# EasyEDA Pro project lovelessing-d133-mobile-phone-development-bo-91bf7213.epro, schematic Schematic1_1, sheets 4 to 5 of 5

## Sheets
4 AUDIO
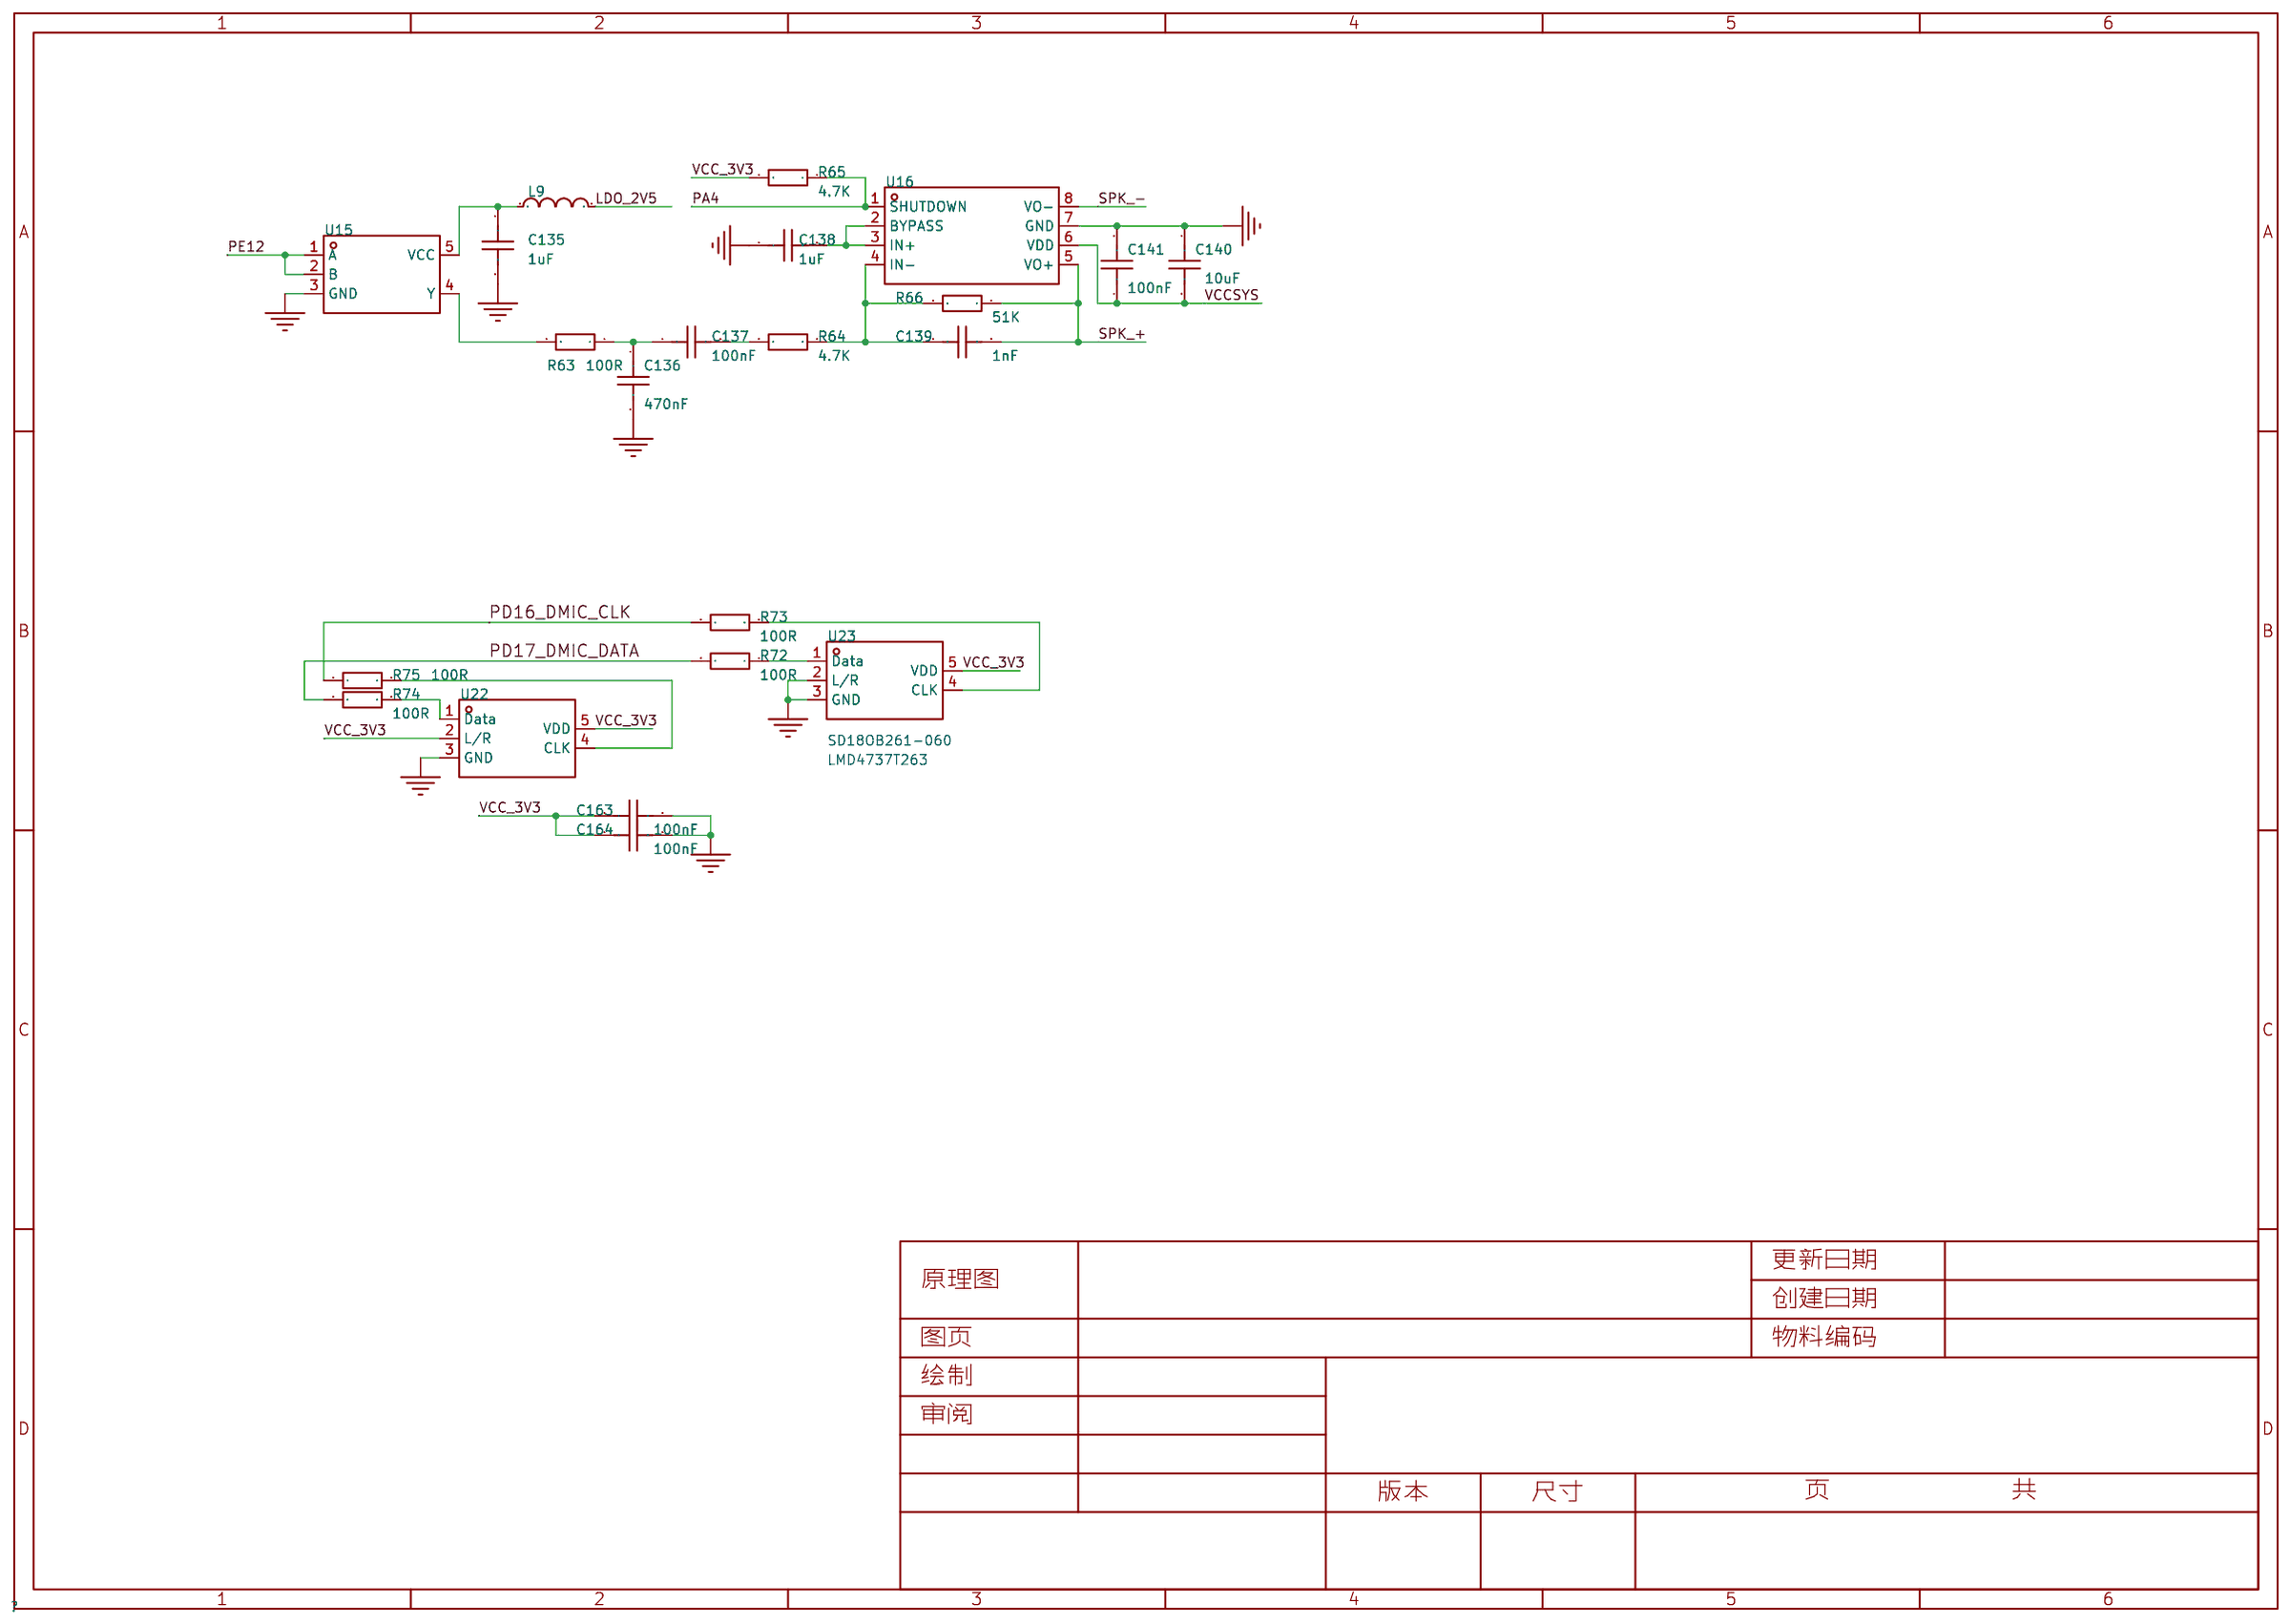
[diagram p4: AUDIO]
5 USB
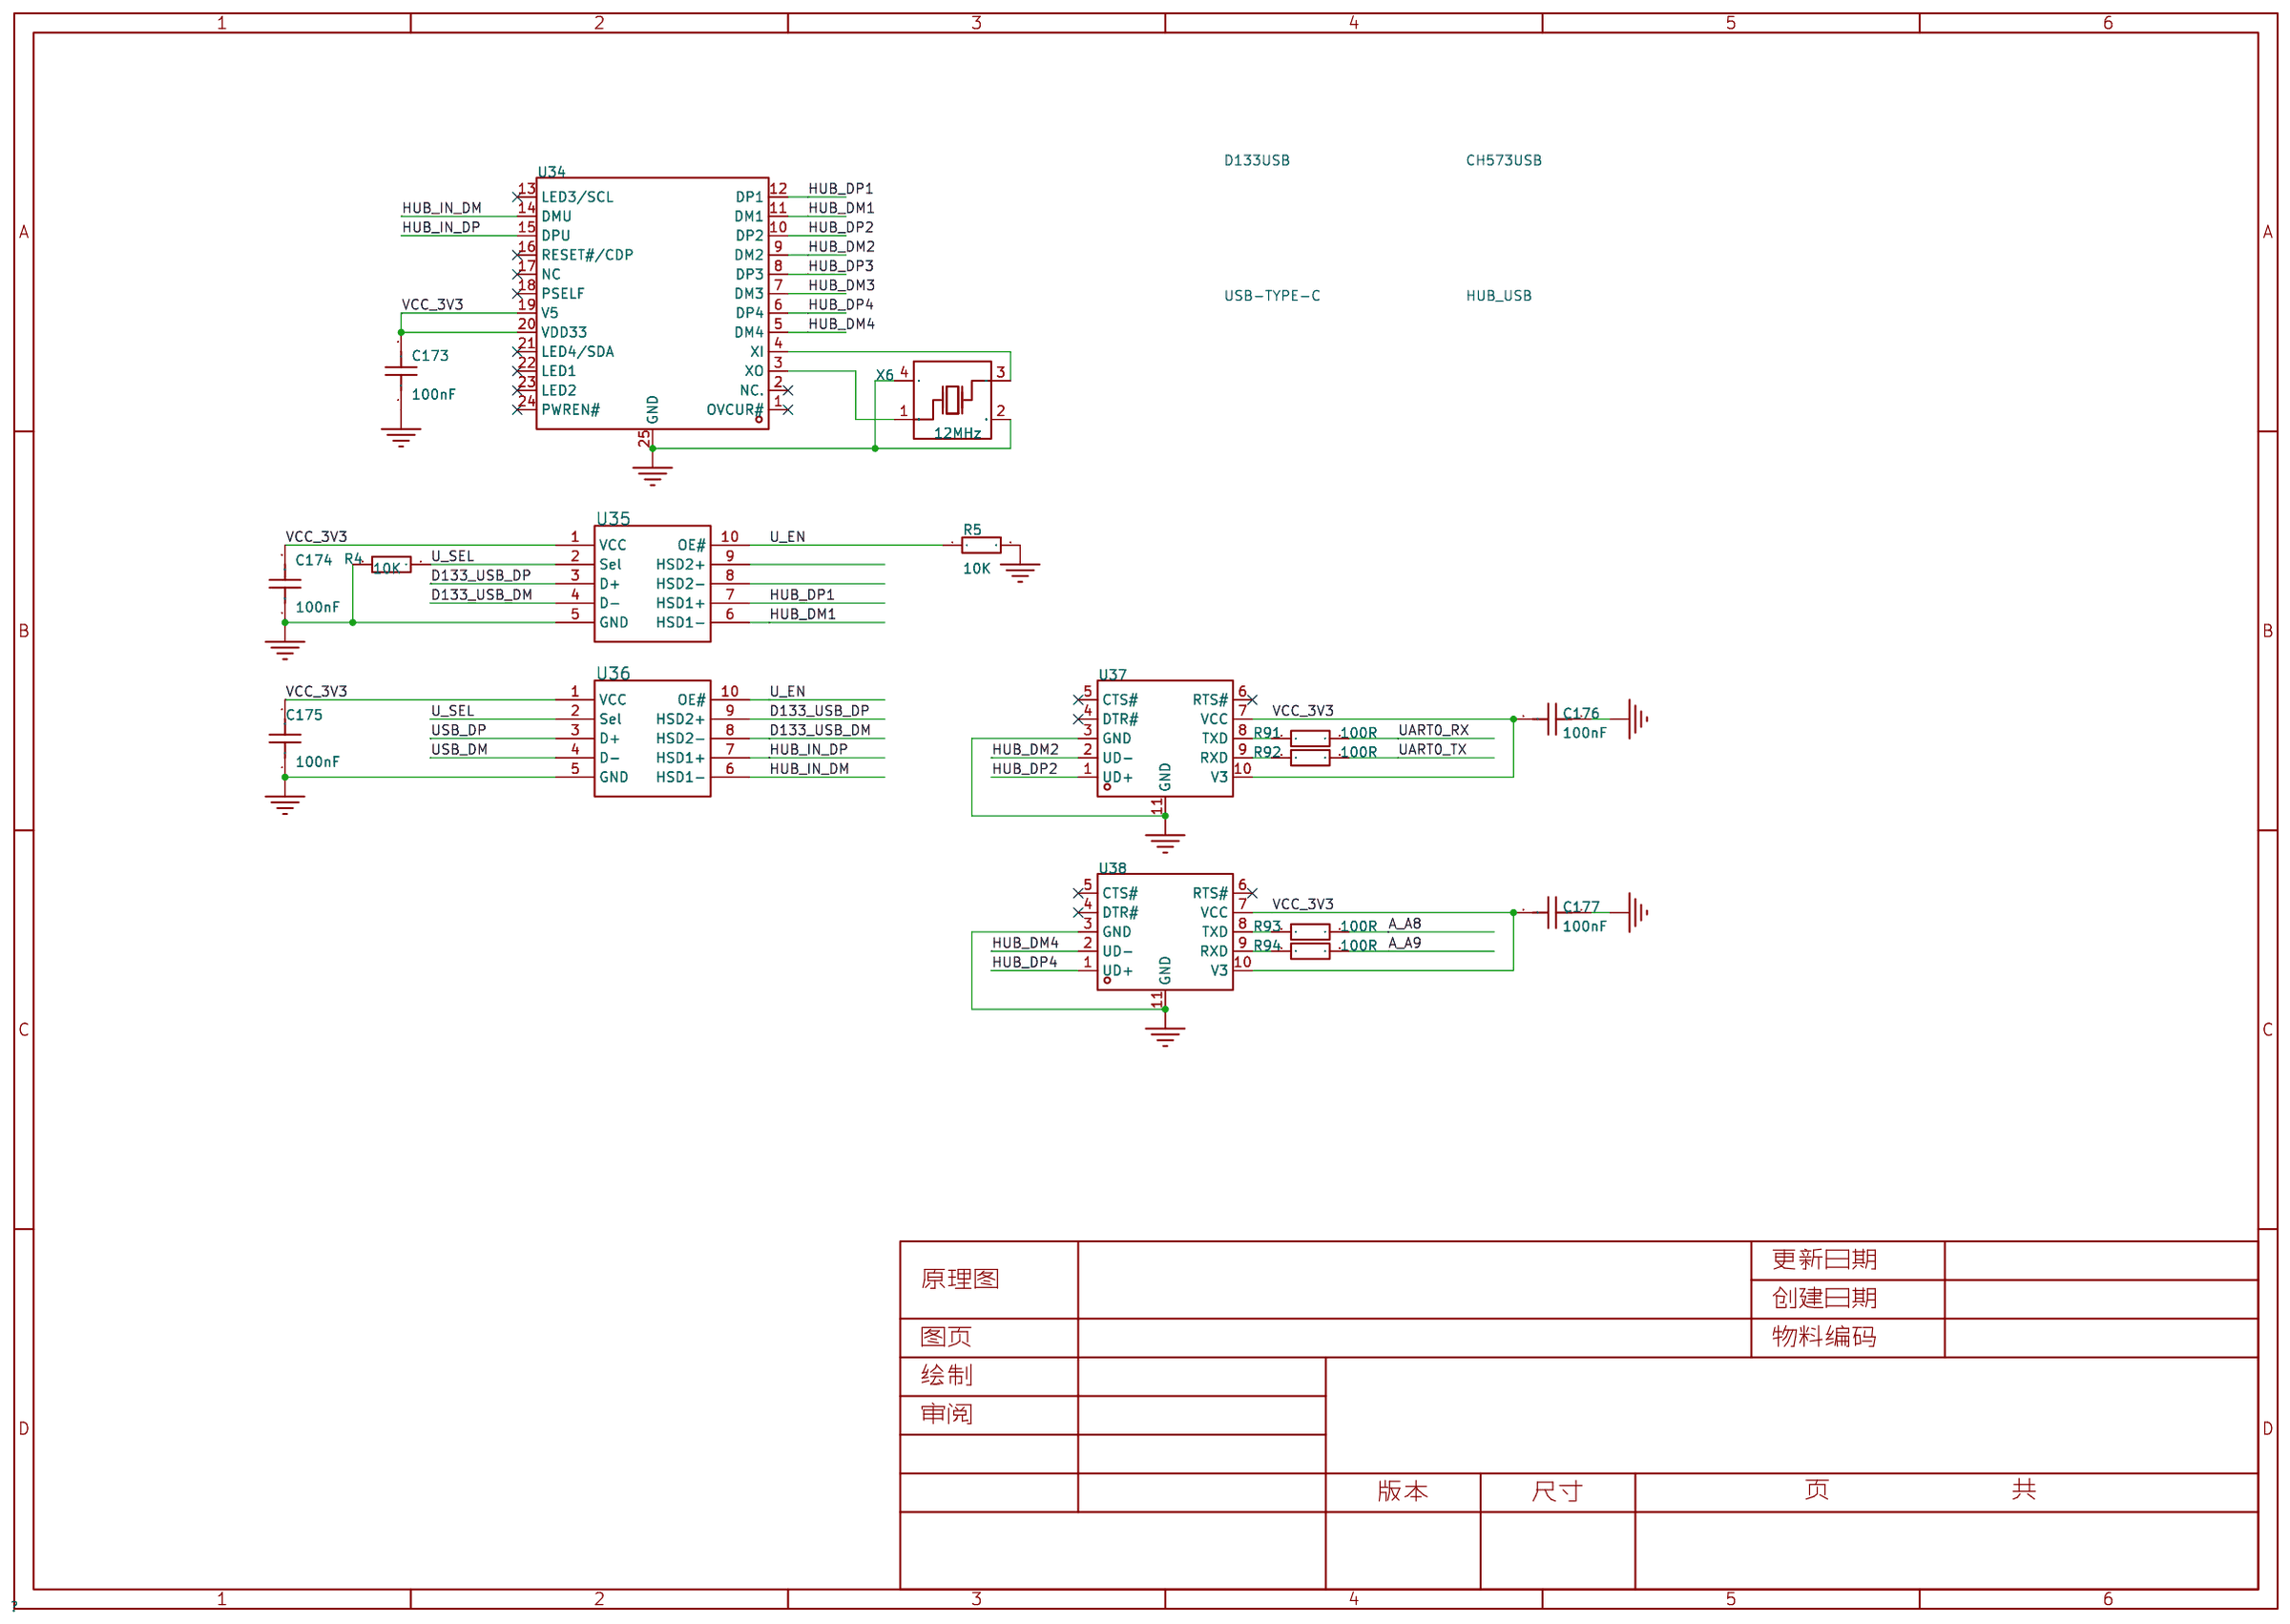
[diagram p5: USB]

## Parts
sheet AUDIO
C135  1uF  [C0603]
C136  470nF  [C0603]
C137  100nF  [C0603]
C138  1uF  [C0603]
C139  1nF  [C0603]
C140  10uF  [C0603]
C141  100nF  [C0603]
C163  100nF  [C0603]
C164  100nF  [C0603]
L9  BLM18AG601SN1D  [L0603]
R63  100R  [R0603]
R64  4.7K  [R0603]
R65  4.7K  [R0603]
R66  51K  [R0603]
R72  100R  [R0603]
R73  100R  [R0603]
R74  100R  [R0603]
R75  100R  [R0603]
U15  U74LVC1G08G  [SOT-353-5_L2.0-W1.3-P0.65-LS2.1-BR]
U16  LM4871  [SOIC-8_L4.9-W3.9-P1.27-LS6.0-BL]
U22  SD18OB261-060  [MIC-SMD_SD18OB261-060]
U23  SD18OB261-060  [MIC-SMD_SD18OB261-060]
sheet USB
C173  100nF  [C0603]
C174  100nF  [C0603]
C175  100nF  [C0603]
C176  100nF  [C0603]
C177  100nF  [C0603]
R4  10K  [R0603]
R5  10K  [R0603]
R91  100R  [R0603]
R92  100R  [R0603]
R93  100R  [R0603]
R94  100R  [R0603]
U34  CH334F  [QFN-24_L4.0-W4.0-P0.50-BL-EP2.8]
U35  FSUSB42MUX  [MSOP-10_L3.0-W3.0-P0.50-LS5.0-BL]
U36  FSUSB42MUX  [MSOP-10_L3.0-W3.0-P0.50-LS5.0-BL]
U37  CH340K  [ESOP-10_L4.9-W3.9-P1.00-LS6.0-BL-EP]
U38  CH340K  [ESOP-10_L4.9-W3.9-P1.00-LS6.0-BL-EP]
X6  12MHz  [OSC-SMD_4P-L3.2-W2.5-BL]

## Library data of the parts
C135-C141 C163 C164 = CL10A106MA8NRNC: 容值:10uF;精度:±20%;额定电压:25V;温度系数:X5R;; LCSC Part Name: 10uF ±20% 25V; Supplier Part: C96446; Manufacturer: SAMSUNG(三星); Supplier Footprint: 0603; JLCPCB Part Class: 基础库; Datasheet: https://atta.szlcsc.com/upload/public/pdf/source/20170325/1490427913016.pdf; Supplier: LCSC; Tolerance: ±20%; Voltage Rated: 25V; Temperature Coefficient: X5R
L9 = BLM18AG601SN1D: 标称阻抗@测试频率:600Ω@100MHz;误差:±25%;直流电阻(RDC):380mΩ;; LCSC Part Name: 单路 0603磁珠 阻抗600Ω@100MHz; Supplier Part: C19330; Manufacturer: muRata(村田); Supplier Footprint: 0603; JLCPCB Part Class: 扩展库; Datasheet: https://atta.szlcsc.com/upload/public/pdf/source/20180329/C160981_FD3C2D2622A377E203B89F4AA32B0741.pdf; Supplier: LCSC; Impedance @ Frequency: 600Ω@100MHz; Tolerance: ±25%; DC Resistance: 380mΩ; Current Rating: 500mA; Circuits: 1
R63-R66 R72-R75 = 0603WAF1502T5E: LCSC Part Name: 15KΩ(1502) ±1% 编带; Supplier Part: C22809; Manufacturer: UNI-ROYAL(厚声); Supplier Footprint: 0603; JLCPCB Part Class: 基础库; Datasheet: https://atta.szlcsc.com/upload/public/pdf/source/20170920/C22809_1505887473690980606.pdf; Supplier: LCSC
U15 = U74LVC1G08G: Supplier Part: C7494898; Manufacturer: UTC(友顺); Supplier Footprint: SOT-353; JLCPCB Part Class: 扩展库; Datasheet: https://atta.szlcsc.com/upload/public/pdf/source/20230718/731A97F03DFF03A953CF98E5B6C56EC5.pdf; Supplier: LCSC
U16 = LM4871_C7494970: 音频功率放大器@@单声道带关断模式，桥式音频功率放大器。在输入1KHz,5V工作电压时，最大驱动功 率为：3W（4Ω负载，THD&lt;10%），2W（4Ω负载，THD&lt;1%）；音频范围内总谐波失真噪音小于1%（20Hz-20KHz）； 应用电路简单，只需要极少数外围器件，就能提供高品质的输出功率。输出不需要外接耦合电容或 上举电容、缓冲网络、反馈电阻。; Supplier: LCSC; Supplier Part: C7494970; Manufacturer: IDCHIP(英锐芯); JLCPCB Part Class: 扩展库; Supplier Footprint: SOP-8; Datasheet: https://atta.szlcsc.com/upload/public/pdf/source/20231229/73188F9C05492146B0D4BFC0A6E99E2B.pdf
U22 = SD18OB261-060: 方向:-;信噪比:-;灵敏度:-;阻抗:-;; Supplier Part: C2895290; Manufacturer: Goertek(歌尔); JLCPCB Part Class: 扩展库; Supplier: LCSC
U23 = SD18OB261-060: 方向:-;信噪比:-;灵敏度:-;阻抗:-;; Supplier Part: C2895290; Manufacturer: Goertek(歌尔); JLCPCB Part Class: 扩展库; Datasheet: https://atta.szlcsc.com/upload/public/pdf/source/20220908/42C65A10ECC5E123C7A6D90000D9CF1D.pdf; Supplier: LCSC
C173-C177 = CAP_0603: Supplier Footprint: 0603
R4 R5 R91-R94 = Res_0603: Supplier Footprint: 0603
U34 = CH334F_C5187527: Supplier Part: C5187527; Manufacturer: WCH(南京沁恒); Supplier Footprint: QFN-24(4x4); JLCPCB Part Class: 扩展库; Datasheet: https://atta.szlcsc.com/upload/public/pdf/source/20240313/0A90B4344DBFB1B295B73A4884A13F29.pdf; Supplier: LCSC
U35 U36 = FSUSB42MUX: FSUSB42 是一款双向、小功率、两端口、高速 USB2.0 开关。它配置为双刀双掷 (DPDT) 开关，适用于两个高速 (480Mbps) 源或高速和全速 (12Mbps) 源之间的切换。FSUSB42 符合 USB2.0 的要求，具有 5.5pF 的极低导通电容 (CON)。此器件的宽带宽 (720MHz) 超过了传递第三谐波所需的带宽，因此信号边缘和相失真都特别小。卓越的沟道-沟道串扰性能还最大程度减少了干扰。FSUSB42 在该开关 I/O 引脚上包含了特殊电路，用于 VCC 供电断电 (VCC; LCSC Part Name: 小功率，两端口，高速 USB2.0 (480Mbps) 开关; Supplier Part: C11355; Manufacturer: onsemi(安森美); Supplier Footprint: MSOP-10; JLCPCB Part Class: Extended Part; Datasheet: https://atta.szlcsc.com/upload/public/pdf/source/20130225/1457706594597.pdf; Supplier: LCSC
U37 U38 = CH340K_C18208922: LCSC Part Name: CH340K 人工转编带; Supplier Part: C18208922; Manufacturer: WCH(南京沁恒); Supplier Footprint: ESSOP-10-150mil-1mm; JLCPCB Part Class: 扩展库; Datasheet: https://atta.szlcsc.com/upload/public/pdf/source/20240313/9D833A30DDFD16C064A7ADE10A944019.pdf; Supplier: LCSC
X6 = X322512MSB4SI: 晶振类型:贴片晶振;频率:12MHz;常温频差:±10ppm;外接负载电容:20pF;频率稳定度(全温):±20ppm;; LCSC Part Name: 12MHz ±10ppm 20pF; Supplier Part: C9002; Manufacturer: YXC(扬兴晶振); Supplier Footprint: SMD3225-4P; JLCPCB Part Class: 基础库; Datasheet: https://atta.szlcsc.com/upload/public/pdf/source/20240329/19D5F850207469550BEB00D7DFEDBC7A.pdf; Supplier: LCSC; Crystal Type: 贴片晶振; Normal temperature Frequency Tolerance: ±10ppm; External load capacitor: 20pF; Frequency Stability(Full temperature range): ±20ppm; Operating Temperature: -40℃~+85℃

## Nets
GND: C135.2 C136.2 C138.1 C140.1 C141.2 C163.2 C164.2 C173.1 C174.1 C175.1 C176.1 C177.1 R4.1 R5.2 U15.3(GND) U16.7(GND) U22.3(GND) U23.2(L/R) U23.3(GND) U34.25(GND) U35.5(GND) U36.5(GND) U37.3(GND) U37.11(GND) U38.3(GND) U38.11(GND) X6.2(GND) X6.4(GND) ; also on sheet 1 2 3
VCC_3V3: C163.1 C164.1 C173.2 C174.2 C175.2 C176.2 C177.2 R65.2 U22.2(L/R) U22.5(VDD) U23.5(VDD) U34.19(V5) U34.20(VDD33) U35.1(VCC) U36.1(VCC) U37.7(VCC) U37.10(V3) U38.7(VCC) U38.10(V3) ; also on sheet 1 2 3
VCCSYS: C140.2 C141.1 U16.6(VDD) ; also on sheet 2 3
A_A8: R93.2 ; also on sheet 3
A_A9: R94.2 ; also on sheet 3
A_A15: R4.2 U35.2(Sel) U36.2(Sel) ; also on sheet 3
A_B10: U34.7(DM3) ; also on sheet 3
A_B11: U34.8(DP3) ; also on sheet 3
CAN0_TX: R65.1 U16.1(SHUTDOWN) ; also on sheet 1
D133_USB_DM: U35.4(D-) U36.8(HSD2-) ; also on sheet 1
D133_USB_DP: U35.3(D+) U36.9(HSD2+) ; also on sheet 1
HUB_DM1: U34.11(DM1) U35.6(HSD1-)
HUB_DM2: U34.9(DM2) U37.2(UD-)
HUB_DM4: U34.5(DM4) U38.2(UD-)
HUB_DP1: U34.12(DP1) U35.7(HSD1+)
HUB_DP2: U34.10(DP2) U37.1(UD+)
HUB_DP4: U34.6(DP4) U38.1(UD+)
HUB_IN_DM: U34.14(DMU) U36.6(HSD1-)
HUB_IN_DP: U34.15(DPU) U36.7(HSD1+)
LDO_2V5: L9.2 ; also on sheet 1
PA0: R92.2 ; also on sheet 1
PA1: R91.2 ; also on sheet 1
PD16: R73.2 R75.2 ; also on sheet 1
PD17: R72.2 R74.2 ; also on sheet 1
PE12: U15.1(A) U15.2(B) ; also on sheet 1
SPK_+: C139.2 R66.1 U16.5(VO+)
SPK_-: U16.8(VO-)
U_EN: R5.1 U35.10(OE#) U36.10(OE#)
USB_DM: U36.4(D-) ; also on sheet 3
USB_DP: U36.3(D+) ; also on sheet 3
$4N919: R73.1 U23.4(CLK)
$4N927: C138.2 U16.2(BYPASS) U16.3(IN+)
$4N934: R72.1 U23.1(Data)
$4N937: C135.1 L9.1 U15.5(VCC)
$4N938: R63.2 U15.4(Y)
$4N948: C139.1 R64.1 R66.2 U16.4(IN-)
$4N949: C136.1 C137.1 R63.1
$4N951: C137.2 R64.2
$4N952: R74.1 U22.1(Data)
$4N953: R75.1 U22.4(CLK)
$5N195: U34.3(XO) X6.1(OSC1)
$5N201: U34.4(XI) X6.3(OSC2)
$5N987: R91.1 U37.8(TXD)
$5N1049: R92.1 U37.9(RXD)
$5N1622: R93.1 U38.8(TXD)
$5N1623: R94.1 U38.9(RXD)

Not connected (* = marked no-connect by the designer): U34 1(OVCUR#)* 2(NC.)* 13(LED3/SCL)* 16(RESET#/CDP)* 17(NC)* 18(PSELF)* 21(LED4/SDA)* 22(LED1)* 23(LED2)* 24(PWREN#)*; U35 8(HSD2-) 9(HSD2+); U37 4(DTR#)* 5(CTS#)* 6(RTS#)*; U38 4(DTR#)* 5(CTS#)* 6(RTS#)*

## Notes on the sheets
sheet 4
- SD18OB261-060
- LMD4737T263
sheet 5
- D133USB
- CH573USB
- USB-TYPE-C
- HUB_USB
